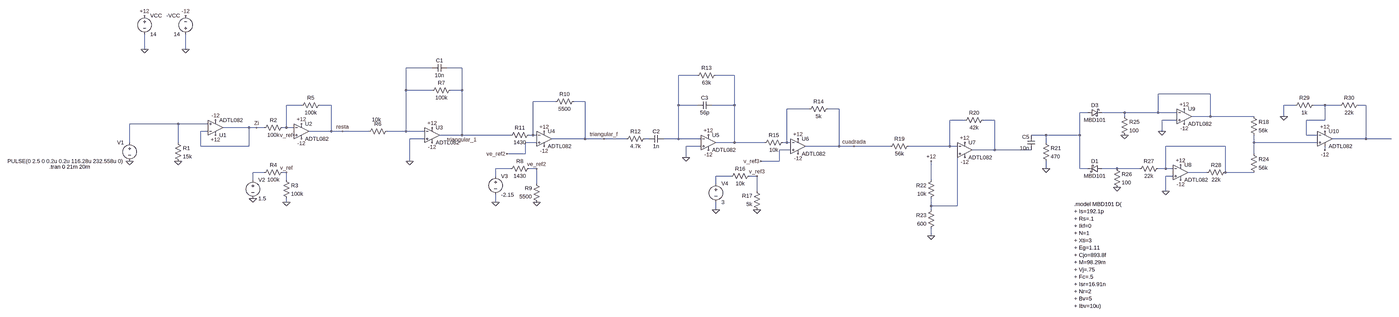
[diagram p0: schematic Tp2_simulacion.asc, whole sheet]
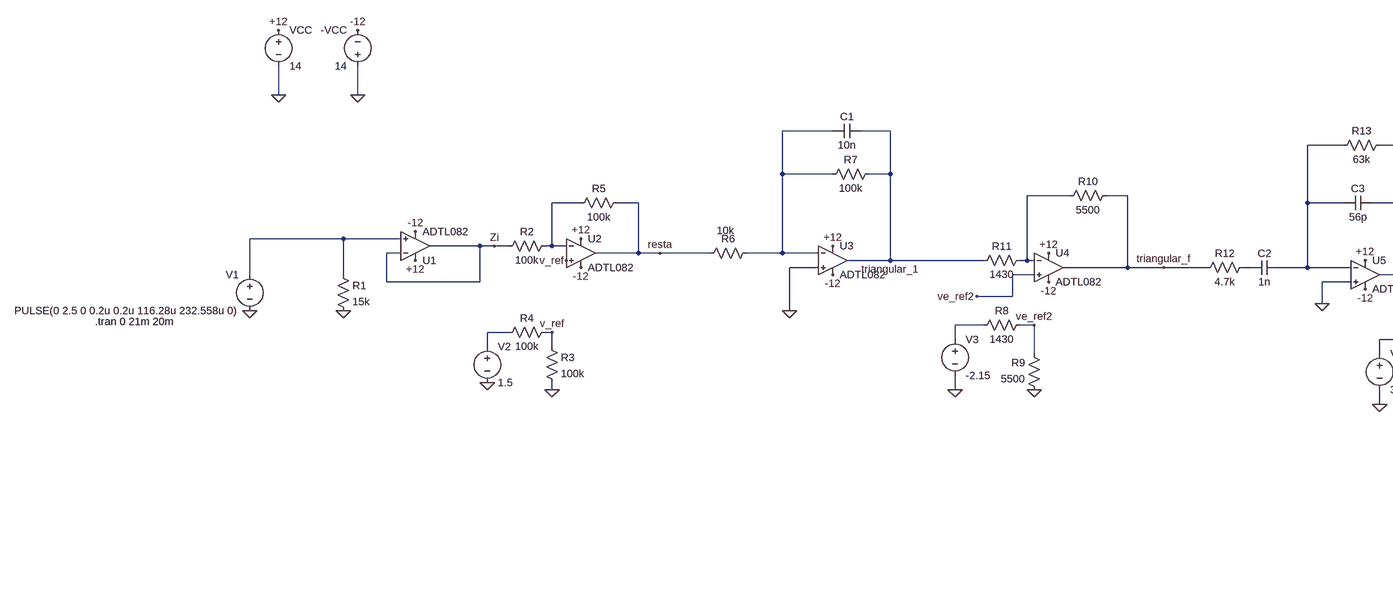
[diagram p1: schematic Tp2_simulacion.asc, part, row 1 of 1, column 1 of 2]
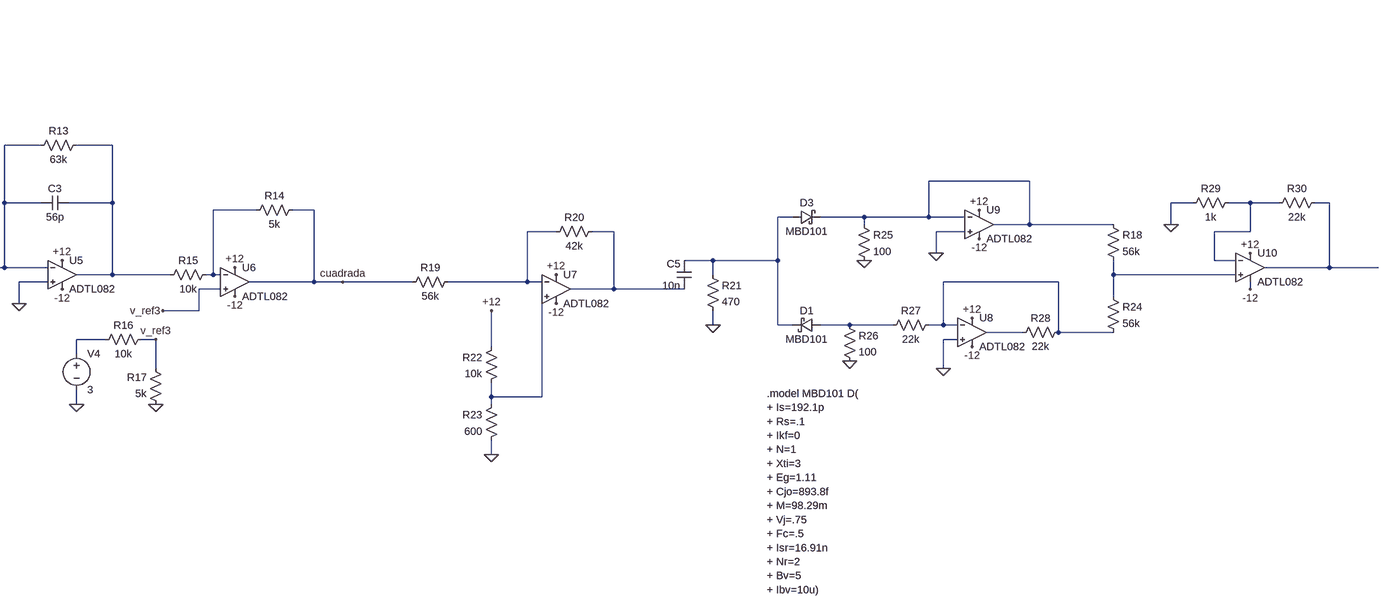
[diagram p2: schematic Tp2_simulacion.asc, part, row 1 of 1, column 2 of 2]
Tp2_simulacion.asc, the LTspice schematic file:
Version 4.1
SHEET 1 5332 832
WIRE -160 -240 -160 -304
WIRE 16 -240 16 -304
WIRE 1072 -160 960 -160
WIRE 1200 -160 1136 -160
WIRE 2208 -128 2128 -128
WIRE 2368 -128 2288 -128
WIRE 960 -64 960 -160
WIRE 1072 -64 960 -64
WIRE 1200 -64 1200 -160
WIRE 1200 -64 1152 -64
WIRE 4432 -48 4208 -48
WIRE 1600 -16 1504 -16
WIRE 1728 -16 1680 -16
WIRE 512 0 448 0
WIRE 640 0 592 0
WIRE 2128 0 2128 -128
WIRE 2208 0 2128 0
WIRE 2368 0 2368 -128
WIRE 2368 0 2272 0
WIRE 4896 0 4848 0
WIRE 5024 0 4976 0
WIRE 5088 0 5024 0
WIRE 5200 0 5168 0
WIRE 2688 16 2592 16
WIRE 2816 16 2768 16
WIRE 3904 32 3872 32
WIRE 4064 32 3968 32
WIRE 4208 32 4208 -48
WIRE 4208 32 4064 32
WIRE 4288 32 4208 32
WIRE 4064 48 4064 32
WIRE 4432 48 4432 -48
WIRE 4432 48 4352 48
WIRE 4720 48 4432 48
WIRE 4848 48 4848 0
WIRE 3376 64 3312 64
WIRE 3504 64 3456 64
WIRE 4288 64 4224 64
WIRE 5024 64 5024 0
WIRE 5024 64 4944 64
WIRE -16 80 -224 80
WIRE 112 80 -16 80
WIRE 288 96 176 96
WIRE 320 96 288 96
WIRE 352 96 320 96
WIRE 448 96 448 0
WIRE 448 96 432 96
WIRE 480 96 448 96
WIRE 112 112 80 112
WIRE 640 112 640 0
WIRE 640 112 544 112
WIRE 688 112 640 112
WIRE 800 112 688 112
WIRE 960 112 960 -64
WIRE 960 112 880 112
WIRE 1040 112 960 112
WIRE 4224 112 4224 64
WIRE 1200 128 1200 -64
WIRE 1200 128 1104 128
WIRE 1408 128 1200 128
WIRE 1504 128 1504 -16
WIRE 1504 128 1488 128
WIRE 1520 128 1504 128
WIRE 3728 128 3664 128
WIRE 3872 128 3872 32
WIRE 3872 128 3728 128
WIRE 4944 128 4944 64
WIRE 4992 128 4944 128
WIRE 1040 144 976 144
WIRE 1728 144 1728 -16
WIRE 1728 144 1584 144
WIRE 1808 144 1728 144
WIRE 1904 144 1808 144
WIRE 2000 144 1984 144
WIRE 2128 144 2128 0
WIRE 2128 144 2064 144
WIRE 2224 144 2128 144
WIRE 5200 144 5200 0
WIRE 5200 144 5056 144
WIRE 5328 144 5200 144
WIRE -224 160 -224 80
WIRE -16 160 -16 80
WIRE 1520 160 1472 160
WIRE 2368 160 2368 0
WIRE 2368 160 2288 160
WIRE 2496 160 2368 160
WIRE 2592 160 2592 16
WIRE 2592 160 2576 160
WIRE 2608 160 2592 160
WIRE 3728 160 3728 128
WIRE 4720 160 4720 128
WIRE 4992 160 4720 160
WIRE 80 176 80 112
WIRE 288 176 288 96
WIRE 288 176 80 176
WIRE 2224 176 2160 176
WIRE 2816 176 2816 16
WIRE 2816 176 2672 176
WIRE 2880 176 2816 176
WIRE 3056 176 2880 176
WIRE 3312 176 3312 64
WIRE 3312 176 3136 176
WIRE 3344 176 3312 176
WIRE 4496 176 4240 176
WIRE 2608 192 2560 192
WIRE 3504 192 3504 64
WIRE 3504 192 3408 192
WIRE 3664 192 3504 192
WIRE 5024 192 5024 176
WIRE 1472 208 1472 160
WIRE 1472 208 1392 208
WIRE 4720 208 4720 160
WIRE 2160 224 2160 176
WIRE 976 240 976 144
WIRE 2560 240 2560 192
WIRE 2560 240 2480 240
WIRE 1408 272 1344 272
WIRE 1520 272 1488 272
WIRE 3728 272 3728 240
WIRE 3872 272 3872 128
WIRE 3904 272 3872 272
WIRE 4032 272 3968 272
WIRE 4128 272 4032 272
WIRE 4240 272 4240 176
WIRE 4240 272 4208 272
WIRE 4272 272 4240 272
WIRE 352 288 304 288
WIRE 448 288 432 288
WIRE 4416 288 4336 288
WIRE 4496 288 4496 176
WIRE 4720 288 4496 288
WIRE 1344 304 1344 272
WIRE 2352 304 2288 304
WIRE 2464 304 2432 304
WIRE 4272 304 4240 304
WIRE 304 320 304 288
WIRE 448 320 448 288
WIRE 3232 320 3232 240
WIRE 1520 336 1520 272
WIRE 2288 336 2288 304
WIRE 2464 368 2464 304
WIRE 4240 368 4240 304
WIRE 448 416 448 400
WIRE 1344 416 1344 384
WIRE 3232 432 3232 400
WIRE 3344 432 3344 208
WIRE 3344 432 3232 432
WIRE 2288 448 2288 416
WIRE 3232 448 3232 432
WIRE 3232 560 3232 528
FLAG 16 -240 0
FLAG -160 -240 0
FLAG -160 -384 +12
FLAG 16 -384 -12
FLAG -16 240 0
FLAG -224 240 0
FLAG 144 128 +12
FLAG 144 64 -12
FLAG 320 96 Zi
FLAG 512 80 +12
FLAG 512 144 -12
FLAG 448 416 0
FLAG 304 400 0
FLAG 448 288 v_ref
FLAG 480 128 v_ref
FLAG 688 112 resta
FLAG 1072 96 +12
FLAG 1072 160 -12
FLAG 976 240 0
FLAG 1552 112 +12
FLAG 1552 176 -12
FLAG 1344 416 0
FLAG 1520 416 0
FLAG 1520 272 ve_ref2
FLAG 1392 208 ve_ref2
FLAG 1200 128 triangular_1
FLAG 1808 144 triangular_f
FLAG 2256 128 +12
FLAG 2256 192 -12
FLAG 2160 224 0
FLAG 2640 144 +12
FLAG 2640 208 -12
FLAG 2288 448 0
FLAG 2464 448 0
FLAG 2880 176 cuadrada
FLAG 2480 240 v_ref3
FLAG 2464 304 v_ref3
FLAG 3376 160 +12
FLAG 3376 224 -12
FLAG 3232 240 +12
FLAG 3232 560 0
FLAG 3728 272 0
FLAG 4320 16 +12
FLAG 4304 256 +12
FLAG 4320 80 -12
FLAG 4304 320 -12
FLAG 4064 128 0
FLAG 4224 112 0
FLAG 4240 368 0
FLAG 4032 352 0
FLAG 5024 112 +12
FLAG 5024 192 -12
FLAG 4848 48 0
SYMBOL OpAmps\\ADTL082 144 160 M180
SYMATTR InstName U1
SYMBOL voltage -224 144 M0
WINDOW 123 0 0 Left 0
WINDOW 39 0 0 Left 0
SYMATTR InstName V1
SYMATTR Value PULSE(0 2.5 0 0.2u 0.2u 116.28u 232.558u 0)
SYMBOL res -32 144 R0
SYMATTR InstName R1
SYMATTR Value 15k
SYMBOL voltage -160 -400 R0
WINDOW 123 0 0 Left 0
WINDOW 39 0 0 Left 0
SYMATTR InstName VCC
SYMATTR Value 14
SYMBOL voltage 16 -288 R180
WINDOW 0 24 96 Left 2
WINDOW 3 24 16 Left 2
SYMATTR InstName -VCC
SYMATTR Value 14
SYMBOL voltage 304 304 R0
WINDOW 123 0 0 Left 0
WINDOW 39 0 0 Left 0
SYMATTR InstName V2
SYMATTR Value 1.5
SYMBOL res 448 80 R90
WINDOW 0 0 56 VBottom 2
WINDOW 3 32 56 VTop 2
SYMATTR InstName R2
SYMATTR Value 100k
SYMBOL OpAmps\\ADTL082 512 48 R0
SYMATTR InstName U2
SYMBOL res 432 304 R0
SYMATTR InstName R3
SYMATTR Value 100k
SYMBOL res 448 272 R90
WINDOW 0 0 56 VBottom 2
WINDOW 3 32 56 VTop 2
SYMATTR InstName R4
SYMATTR Value 100k
SYMBOL res 496 16 R270
WINDOW 0 32 56 VTop 2
WINDOW 3 0 56 VBottom 2
SYMATTR InstName R5
SYMATTR Value 100k
SYMBOL OpAmps\\ADTL082 1072 64 R0
SYMATTR InstName U3
SYMBOL res 896 96 R90
WINDOW 0 0 56 VBottom 2
WINDOW 3 -50 62 VTop 2
SYMATTR InstName R6
SYMATTR Value 10k
SYMBOL res 1168 -80 R90
WINDOW 0 0 56 VBottom 2
WINDOW 3 32 56 VTop 2
SYMATTR InstName R7
SYMATTR Value 100k
SYMBOL cap 1136 -176 R90
WINDOW 0 0 32 VBottom 2
WINDOW 3 32 32 VTop 2
SYMATTR InstName C1
SYMATTR Value 10n
SYMBOL OpAmps\\ADTL082 1552 80 R0
SYMATTR InstName U4
SYMBOL voltage 1344 288 R0
SYMATTR InstName V3
SYMATTR Value -2.15
SYMBOL res 1504 256 R90
WINDOW 0 0 56 VBottom 2
WINDOW 3 32 56 VTop 2
SYMATTR InstName R8
SYMATTR Value 1430
SYMBOL res 1536 432 R180
WINDOW 0 36 76 Left 2
WINDOW 3 36 40 Left 2
SYMATTR InstName R9
SYMATTR Value 5500
SYMBOL res 1584 0 R270
WINDOW 0 32 56 VTop 2
WINDOW 3 0 56 VBottom 2
SYMATTR InstName R10
SYMATTR Value 5500
SYMBOL res 1392 144 R270
WINDOW 0 32 56 VTop 2
WINDOW 3 0 56 VBottom 2
SYMATTR InstName R11
SYMATTR Value 1430
SYMBOL OpAmps\\ADTL082 2256 96 R0
SYMATTR InstName U5
SYMBOL res 2000 128 R90
WINDOW 0 0 56 VBottom 2
WINDOW 3 32 56 VTop 2
SYMATTR InstName R12
SYMATTR Value 4.7k
SYMBOL cap 2064 128 R90
WINDOW 0 0 32 VBottom 2
WINDOW 3 32 32 VTop 2
SYMATTR InstName C2
SYMATTR Value 1n
SYMBOL res 2304 -144 R90
WINDOW 0 0 56 VBottom 2
WINDOW 3 32 56 VTop 2
SYMATTR InstName R13
SYMATTR Value 63k
SYMBOL cap 2272 -16 R90
WINDOW 0 0 32 VBottom 2
WINDOW 3 32 32 VTop 2
SYMATTR InstName C3
SYMATTR Value 56p
SYMBOL OpAmps\\ADTL082 2640 112 R0
SYMATTR InstName U6
SYMBOL res 2672 32 R270
WINDOW 0 32 56 VTop 2
WINDOW 3 0 56 VBottom 2
SYMATTR InstName R14
SYMATTR Value 5k
SYMBOL res 2480 176 R270
WINDOW 0 32 56 VTop 2
WINDOW 3 0 56 VBottom 2
SYMATTR InstName R15
SYMATTR Value 10k
SYMBOL voltage 2288 320 R0
SYMATTR InstName V4
SYMATTR Value 3
SYMBOL res 2448 288 R90
WINDOW 0 0 56 VBottom 2
WINDOW 3 32 56 VTop 2
SYMATTR InstName R16
SYMATTR Value 10k
SYMBOL res 2480 464 R180
WINDOW 0 36 76 Left 2
WINDOW 3 36 40 Left 2
SYMATTR InstName R17
SYMATTR Value 5k
SYMBOL OpAmps\\ADTL082 3376 128 R0
SYMATTR InstName U7
SYMBOL res 3152 160 R90
WINDOW 0 0 56 VBottom 2
WINDOW 3 32 56 VTop 2
SYMATTR InstName R19
SYMATTR Value 56k
SYMBOL res 3472 48 R90
WINDOW 0 0 56 VBottom 2
WINDOW 3 32 56 VTop 2
SYMATTR InstName R20
SYMATTR Value 42k
SYMBOL cap 3680 192 R180
WINDOW 0 24 56 Left 2
WINDOW 3 24 8 Left 2
SYMATTR InstName C5
SYMATTR Value 10n
SYMBOL res 3712 144 R0
SYMATTR InstName R21
SYMATTR Value 470
SYMBOL res 3248 304 M0
SYMATTR InstName R22
SYMATTR Value 10k
SYMBOL res 3248 432 M0
SYMATTR InstName R23
SYMATTR Value 600
SYMBOL OpAmps\\ADTL082 4304 224 R0
SYMATTR InstName U8
SYMBOL OpAmps\\ADTL082 4320 -16 R0
SYMATTR InstName U9
SYMBOL res 4704 32 R0
SYMATTR InstName R18
SYMATTR Value 56k
SYMBOL res 4704 192 R0
SYMATTR InstName R24
SYMATTR Value 56k
SYMBOL res 4048 32 R0
SYMATTR InstName R25
SYMATTR Value 100
SYMBOL res 4016 256 R0
SYMATTR InstName R26
SYMATTR Value 100
SYMBOL res 4224 256 R90
WINDOW 0 0 56 VBottom 2
WINDOW 3 32 56 VTop 2
SYMATTR InstName R27
SYMATTR Value 22k
SYMBOL res 4512 272 R90
WINDOW 0 0 56 VBottom 2
WINDOW 3 32 56 VTop 2
SYMATTR InstName R28
SYMATTR Value 22k
SYMBOL schottky 3904 48 R270
WINDOW 0 32 32 VTop 2
WINDOW 3 0 32 VBottom 2
SYMATTR InstName D3
SYMATTR Value MBD101
SYMBOL schottky 3968 256 R90
WINDOW 0 0 32 VBottom 2
WINDOW 3 32 32 VTop 2
SYMATTR InstName D1
SYMATTR Value MBD101
SYMBOL OpAmps\\ADTL082 5024 80 R0
SYMATTR InstName U10
SYMBOL res 4992 -16 R90
WINDOW 0 0 56 VBottom 2
WINDOW 3 32 56 VTop 2
SYMATTR InstName R29
SYMATTR Value 1k
SYMBOL res 5184 -16 R90
WINDOW 0 0 56 VBottom 2
WINDOW 3 32 56 VTop 2
SYMATTR InstName R30
SYMATTR Value 22k
TEXT -568 264 Left 2 !.tran 0 21m 20m
TEXT 3848 424 Left 2 !.model MBD101 D(\n+ Is=192.1p \n+ Rs=.1 \n+ Ikf=0 \n+ N=1 \n+ Xti=3 \n+ Eg=1.11 \n+ Cjo=893.8f \n+ M=98.29m\n+ Vj=.75 \n+ Fc=.5 \n+ Isr=16.91n \n+ Nr=2 \n+ Bv=5 \n+ Ibv=10u)

The netlist it stands for:
* Tp2_simulacion.asc
X§U1 N013 Zi +12 -12 Zi ADTL082  ; pins In+ In- V+ V- OUT
V1 N013 0 PULSE(0 2.5 0 0.2u 0.2u 116.28u 232.558u 0)
R1 N013 0 15k
VCC +12 0 14
V§-VCC 0 -12 14
V2 N019 0 1.5
R2 N006 Zi 100k
X§U2 v_ref N006 +12 -12 resta ADTL082  ; pins In+ In- V+ V- OUT
R3 v_ref 0 100k
R4 v_ref N019 100k
R5 N006 resta 100k
X§U3 0 N001 +12 -12 triangular_1 ADTL082  ; pins In+ In- V+ V- OUT
R6 N001 resta 10k
R7 triangular_1 N001 100k
C1 triangular_1 N001 10n
X§U4 ve_ref2 N005 +12 -12 triangular_f ADTL082  ; pins In+ In- V+ V- OUT
V3 N017 0 -2.15
R8 ve_ref2 N017 1430
R9 0 ve_ref2 5500
R10 N005 triangular_f 5500
R11 triangular_1 N005 1430
X§U5 0 N002 +12 -12 N003 ADTL082  ; pins In+ In- V+ V- OUT
R12 N014 triangular_f 4.7k
C2 N002 N014 1n
R13 N003 N002 63k
C3 N003 N002 56p
X§U6 v_ref3 N009 +12 -12 cuadrada ADTL082  ; pins In+ In- V+ V- OUT
R14 N009 cuadrada 5k
R15 N003 N009 10k
V4 N021 0 3
R16 v_ref3 N021 10k
R17 0 v_ref3 5k
X§U7 N022 N011 +12 -12 N012 ADTL082  ; pins In+ In- V+ V- OUT
R19 N011 cuadrada 56k
R20 N012 N011 42k
C5 N012 N010 10n
R21 N010 0 470
R22 +12 N022 10k
R23 N022 0 600
X§U8 0 N016 +12 -12 N020 ADTL082  ; pins In+ In- V+ V- OUT
X§U9 0 N004 +12 -12 N004 ADTL082  ; pins In+ In- V+ V- OUT
R18 N004 N015 56k
R24 N015 N016 56k
R25 N004 0 100
R26 N018 0 100
R27 N016 N018 22k
R28 N016 N020 22k
D3 N010 N004 MBD101
D1 N018 N010 MBD101
X§U10 N015 N007 +12 -12 N008 ADTL082  ; pins In+ In- V+ V- OUT
R29 N007 0 1k
R30 N008 N007 22k
.model D D
.lib standard.dio
.tran 0 21m 20m
.model MBD101 D(
+ Is=192.1p
+ Rs=.1
+ Ikf=0
+ N=1
+ Xti=3
+ Eg=1.11
+ Cjo=893.8f
+ M=98.29m
+ Vj=.75
+ Fc=.5
+ Isr=16.91n
+ Nr=2
+ Bv=5
+ Ibv=10u)
.lib ADI.lib
.backanno
.end